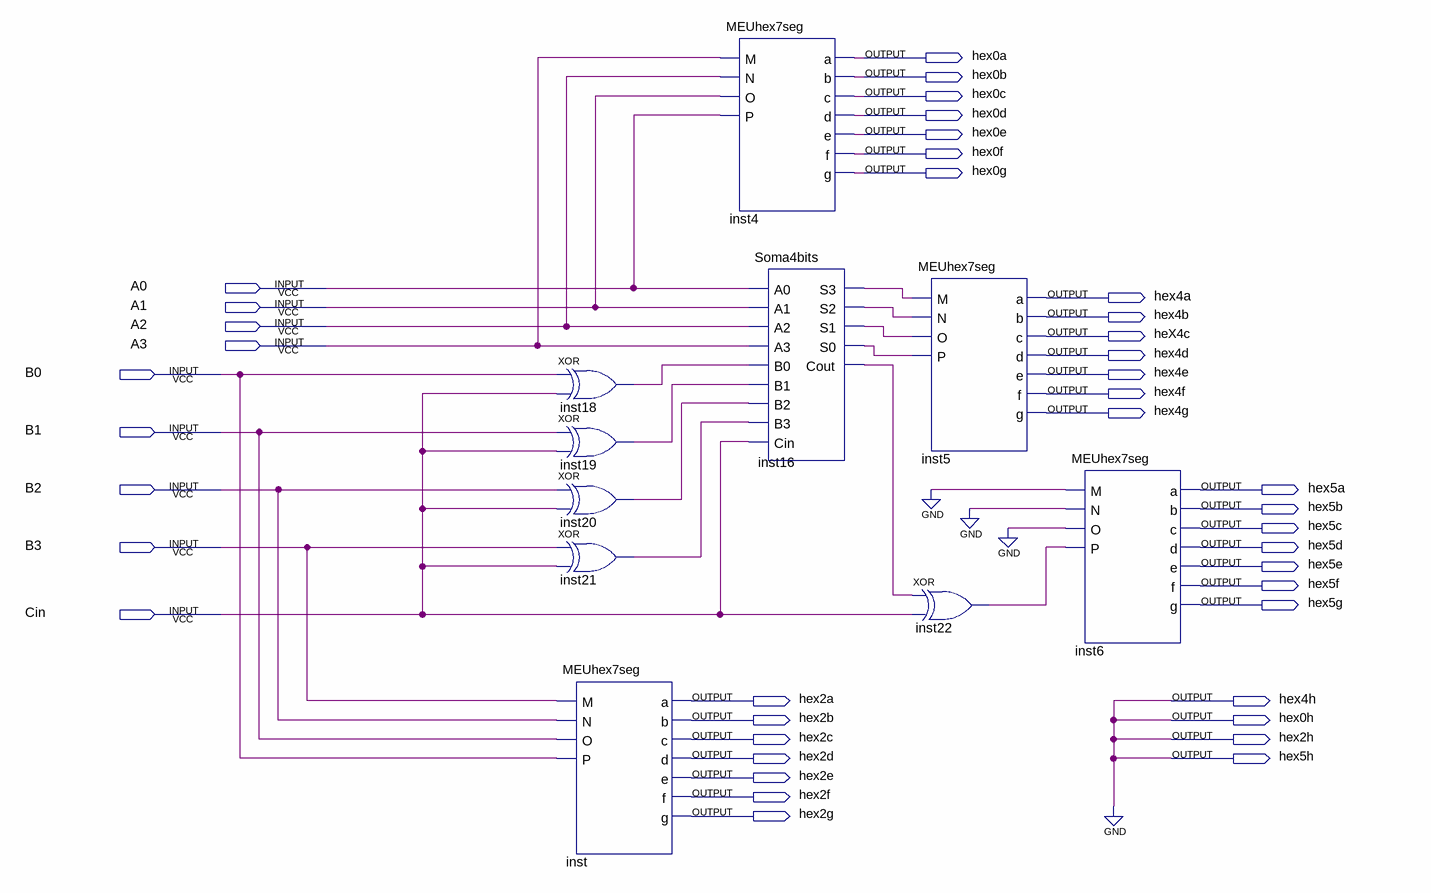
[diagram p0: schematic sheet]
// Quartus schematic Somador4bits.bdf as structural Verilog: 10 symbols, 41 pins
module Somador4bits (
  input  A0,
  input  A1,
  input  A2,
  input  A3,
  input  B0,
  input  B1,
  input  B2,
  input  B3,
  input  Cin,
  output hex0a,
  output hex0b,
  output hex0c,
  output hex0d,
  output hex0e,
  output hex0f,
  output hex0g,
  output hex4a,
  output hex4b,
  output heX4c,
  output hex4d,
  output hex4e,
  output hex4f,
  output hex4g,
  output hex5a,
  output hex5b,
  output hex5c,
  output hex5d,
  output hex5e,
  output hex5f,
  output hex5g,
  output hex2a,
  output hex4h,
  output hex2b,
  output hex0h,
  output hex2c,
  output hex2h,
  output hex2d,
  output hex5h,
  output hex2e,
  output hex2f,
  output hex2g
);

  wire inst16_cout, inst16_s0, inst16_s1, inst16_s2, inst16_s3, inst18_out, inst19_out, inst20_out,
       inst21_out, inst22_out;

  xor inst18 (inst18_out, B0, Cin);
  xor inst19 (inst19_out, B1, Cin);
  xor inst20 (inst20_out, B2, Cin);
  xor inst21 (inst21_out, B3, Cin);
  MEUhex7seg inst (
    .M(B3), .N(B2), .O(B1), .P(B0), .a(hex2a), .b(hex2b), .c(hex2c), .d(hex2d), .e(hex2e), .f(hex2f),
    .g(hex2g));
  MEUhex7seg inst4 (
    .M(A3), .N(A2), .O(A1), .P(A0), .a(hex0a), .b(hex0b), .c(hex0c), .d(hex0d), .e(hex0e), .f(hex0f),
    .g(hex0g));
  Soma4bits inst16 (
    .A0(A0), .A1(A1), .A2(A2), .A3(A3), .B0(inst18_out), .B1(inst19_out), .B2(inst20_out), .B3(inst21_out),
    .Cin(Cin), .S3(inst16_s3), .S2(inst16_s2), .S1(inst16_s1), .S0(inst16_s0), .Cout(inst16_cout));
  MEUhex7seg inst5 (
    .M(inst16_s3), .N(inst16_s2), .O(inst16_s1), .P(inst16_s0), .a(hex4a), .b(hex4b), .c(heX4c), .d(hex4d),
    .e(hex4e), .f(hex4f), .g(hex4g));
  xor inst22 (inst22_out, inst16_cout, Cin);
  MEUhex7seg inst6 (
    .M(1'b0), .N(1'b0), .O(1'b0), .P(inst22_out), .a(hex5a), .b(hex5b), .c(hex5c), .d(hex5d), .e(hex5e),
    .f(hex5f), .g(hex5g));

  assign hex0h = 1'b0;
  assign hex2h = 1'b0;
  assign hex4h = 1'b0;
  assign hex5h = 1'b0;
endmodule
